# Altium schematic sheet Relay-Sheet.SchDoc: =Projectname
size A4; SheetNumber: 6; SheetTotal: 9
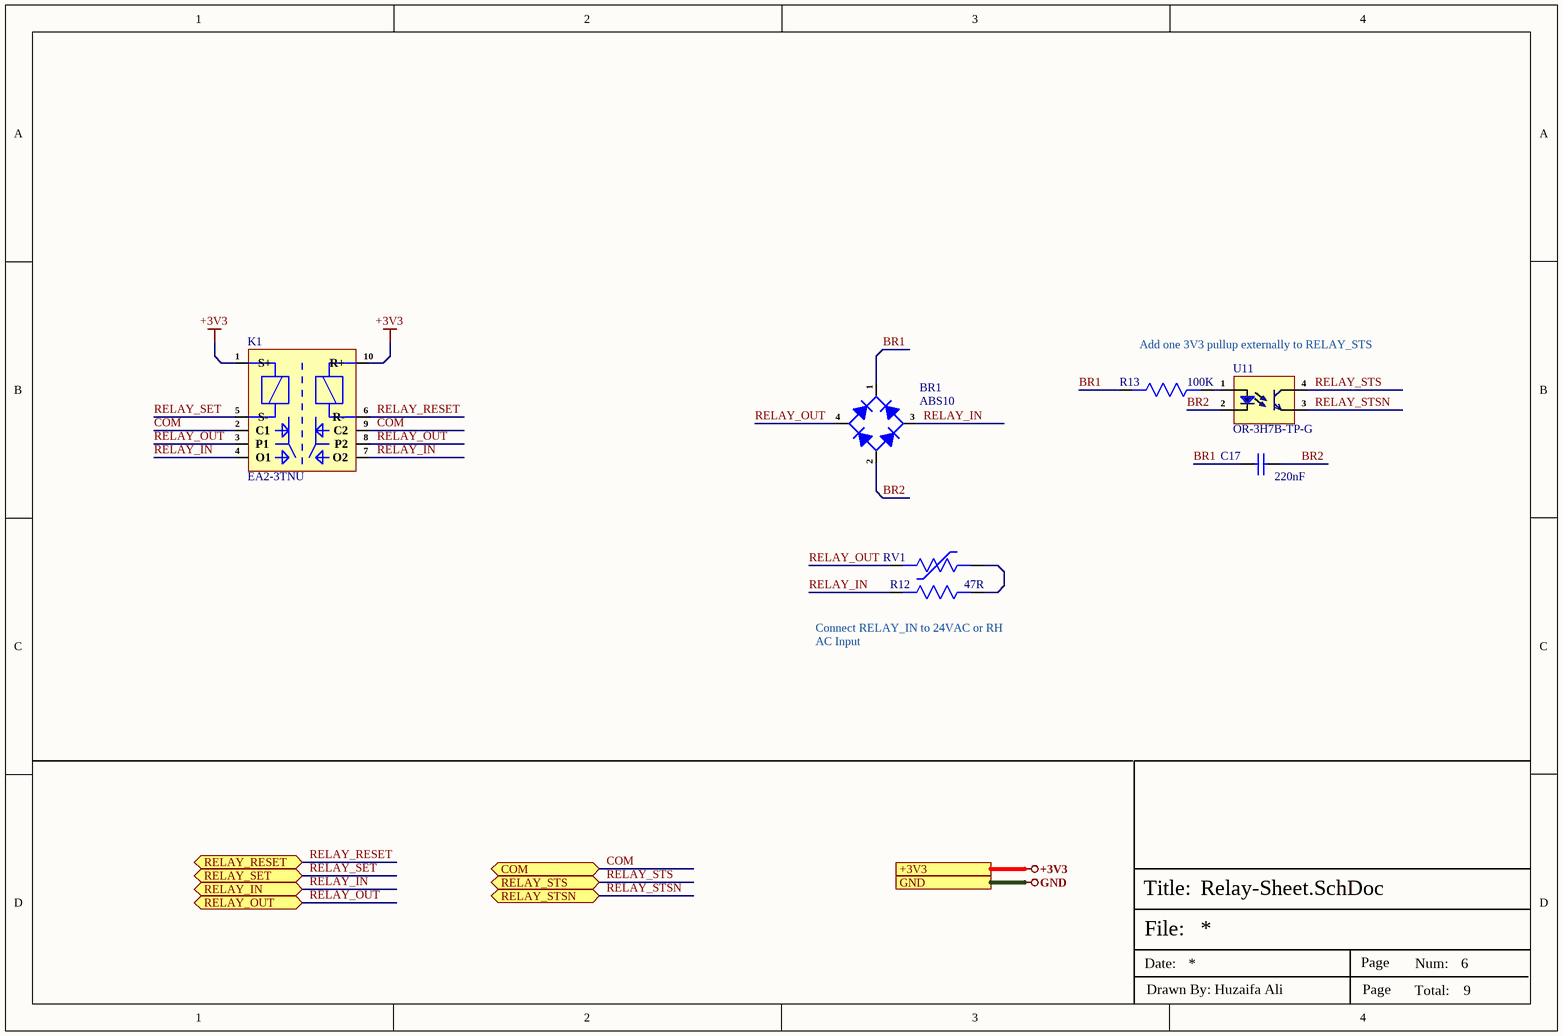
[diagram p0: Relay-Sheet.SchDoc]

## Parts
BR1  ABS10  [ABS]
C17  220nF  [Cap-1206]
K1  EA2-3TNU  [EA2-3TNU]
R12  47R  [Res-0402]
R13  100K  [Res-0402]
RV1  ERZ-V07D680  [ERZ-V07D680]  (value not drawn)
U11  OR-3H7B-TP-G  [SOP-4-1.27mm pitch Body 2.6mm]

## Ports
+3V3, COM (bidir), GND, RELAY_IN (bidir), RELAY_OUT (bidir), RELAY_RESET (bidir), RELAY_SET (bidir), RELAY_STS (bidir), RELAY_STSN (bidir)

## Nets
+3V3: K1.1(S+) K1.10(R+) ; port +3V3
GND: port GND
BR1: BR1.1 C17.2 R13.2
BR2: BR1.2 C17.1 U11.2(Ca)
COM: K1.2(C1) K1.9(C2) ; port COM
RELAY_IN: BR1.3 K1.4(O1) K1.7(O2) R12.2 ; port RELAY_IN
RELAY_OUT: BR1.4 K1.3(P1) K1.8(P2) RV1.2 ; port RELAY_OUT
RELAY_RESET: K1.6(R-) ; port RELAY_RESET
RELAY_SET: K1.5(S-) ; port RELAY_SET
RELAY_STS: U11.4(C) ; port RELAY_STS
RELAY_STSN: U11.3(E) ; port RELAY_STSN
NetR12_1: R12.1 RV1.1
NetR13_1: R13.1 U11.1(An)

## Notes on the sheet
- Add one 3V3 pullup externally to RELAY_STS
- (near R12) Connect RELAY_IN to 24VAC or RH
  AC Input
- File:
- Title:
- Date:
- Page
- Num:
- Total:
- Drawn By: Huzaifa Ali

## Library data of the parts
BR1 = ABS10: 5uA@1kV 1V@0.4A 1A 1kV -55℃~+150℃@(Tj) ABS Bridge Rectifiers ROHS; Manufacturer: FOSAN; Package: ABS; Manufacturer Part Number: ABS10; Item Type: Bridge Rectifier; LCSC Part Number: C3014049; ComponentLink1Description: LCSC; ComponentLink1URL: https://www.lcsc.com/product-detail/Bridge-Rectifiers_FOSAN-ABS10_C3014049.html
C17 = 1206B224K500NT: 50V 220nF X7R ±10% 1206 Multilayer Ceramic Capacitors MLCC - SMD/SMT ROHS; Manufacturer: FH; Manufacturer Part Number: 1206B224K500NT; Package: 1206; LCSC Part Number: C1857; Item Type: Capacitor; ComponentLink1Description: LCSC; ComponentLink1URL: https://www.lcsc.com/product-detail/Multilayer-Ceramic-Capacitors-MLCC-SMD-SMT_FH-Guangdong-Fenghua-Advanced-Tech-1206B224K500NT_C1857.html
K1 = EA2-3TNU: Relay Gen Purpose DPDT 1A 3VDC; Manufacturer: KEMET; Coil Current: 46.7mA; Coil Type: Latching, Dual Coil; Coil Voltage (DC): 3V; Coil Resistance: 64.3R; Relay Type: General Purpose; Operate Time: 2ms; Release Time: 1ms; Coil Power: 140mW; Supplier 1: Mouser; Manufacturer Part Number: EA2-3TNU; RoHS: No; Category: Uncategorized; Stock 1: 873; Pricing 1: 1=3.85000, 10=3.11000, 50=3.11000, 100=2.42000, 250=2.00000, 500=1.85000, 1000=1.85000, 3600=1.58000, 10000=1.58000 (USD); Mount: Through Hole; Contact Material: Gold,Silver; Min Operating Temperature: -40°C; Max Operating Temperature: 85°C; Throw Configuration: DPDT; Package Quantity: 3600; Termination: PC Pin; Packaging: Rail/Tube; Contact Current Rating: 1A; RoHS Compliant: No; ComponentLink1URL: https://api.kemet.com/component-edge/download/datasheet/EA2-3TNU.pdf?src-supplier=Digi-Key; ComponentLink1Description: https://api.kemet.com/component-edge/download/datasheet/EA2-3TNU.pdf?src-supplier=Digi-Key; Supplier Part Number 1: 80-EA2-3TNU; LCSC Part Number: C1560650; Item Type: Relay
R12 = RC0402FR-0747RL: RES 47 OHM 1% 1/16W 0402; Manufacturer: Yageo; Temperature Coefficient: 100ppm/°C; Power Rating: 63mW; Voltage Rating: 50V; Supplier 1: Digi-Key; Manufacturer Part Number: RC0402FR-0747RL; RoHS: Yes; Category: Chip SMD Resistors; Stock 1: 913647; Pricing 1: 1=0.10000, 10=0.01400, 100=0.00580, 1000=0.00262, 2500=0.00228, 5000=0.00188 (USD); Case/Package: 0402; Case Code (Metric): 1005; Case Code (Imperial): 0402; Weight: 2.3E-05oz; Size Code: 0402; Min Operating Temperature: -55°C; Max Operating Temperature: 155°C; Resistance: 47R; Tolerance: 1%; Packaging: Tape and Reel; Resistor Type: Thick Film; Package Quantity: 1; Number of Terminations: 2; Termination: SMD/SMT; Max Power Dissipation: 63mW; Features: Moisture Resistant; Series: RC; Construction: Rectangular; Technology: THICK FILM; Resistance Tolerance: 1%; Length: 1mm; Width: 0.02inch; Height: 0.016inch; Depth: 0.5mm; Lead Free: Lead Free; Military Standard: Not; RoHS Compliant: Yes; Supplier Part Number 1: 311-47.0LRCT-ND
R13 = RC0402FR-07100KL: RES 100K OHM 1% 1/16W 0402; Manufacturer: Yageo; Resistance: 100kR; Temperature Coefficient: 100ppm/°C; Power Rating: 63mW; Voltage Rating: 50V; Supplier 1: Mouser; Manufacturer Part Number: RC0402FR-07100KL; RoHS: Yes; Category: Chip SMD Resistors; Stock 1: 7759549; Pricing 1: 1=0.10000, 10=0.01200, 50=0.01200, 100=0.00500, 1000=0.00300, 2500=0.00200, 10000=0.00100 (USD); Case/Package: 0402; Case Code (Metric): 1005; Case Code (Imperial): 0402; Min Operating Temperature: -55°C; Max Operating Temperature: 155°C; Resistor Type: Thick Film; Tolerance: 1%; Packaging: Tape and Reel; Package Quantity: 1; Number of Terminations: 2; Termination: SMD/SMT; Max Power Dissipation: 63mW; Working Voltage: 50V; Features: Moisture Resistant; Series: RC; Resistance Tolerance: 1%; Construction: Rectangular; Technology: THICK FILM; Length: 0.039inch; Width: 0.02inch; Height: 0.016inch; Depth: 0.5mm; REACH SVHC: No SVHC; Lead Free: Lead Free; RoHS Compliant: Yes; Military Standard: Not; ComponentLink1URL: https://datasheet.ciiva.com/11819/0900766b80c66297-11819452.pdf?src-supplier=RSComponents; ComponentLink1Description: https://datasheet.ciiva.com/11819/0900766b80c66297-11819452.pdf?src-supplier=RSComponents; ComponentLink2URL: https://datasheet.ciiva.com/22747/1018594-22747509.pdf?src-supplier=Element14; ComponentLink2Description: https://datasheet.ciiva.com/22747/1018594-22747509.pdf?src-supplier=Element14; ComponentLink3URL: https://datasheet.ciiva.com/2453/pyu-r-int-thick-7-2453362.pdf?src-supplier=Digi-Key; ComponentLink3Description: https://datasheet.ciiva.com/2453/pyu-r-int-thick-7-2453362.pdf?src-supplier=Digi-Key; ComponentLink4URL: https://datasheet.ciiva.com/2453/pyu-r-int-thick-7-2453363.pdf?src-supplier=Digi-Key; ComponentLink4Description: https://datasheet.ciiva.com/2453/pyu-r-int-thick-7-2453363.pdf?src-supplier=Digi-Key; ComponentLink5URL: https://datasheet.ciiva.com/2453/pyu-r-int-thick-7-2453361.pdf?src-supplier=Digi-Key; ComponentLink5Description: https://datasheet.ciiva.com/2453/pyu-r-int-thick-7-2453361.pdf?src-supplier=Digi-Key; ComponentLink6URL: https://datasheet.ciiva.com/12667/pyu-rc0402-51-rohs-l-6-r-12667930.pdf?src-supplier=Mouser; ComponentLink6Description: https://datasheet.ciiva.com/12667/pyu-rc0402-51-rohs-l-6-r-12667930.pdf?src-supplier=Mouser; ComponentLink7URL: https://datasheet.ciiva.com/15189/getdatasheetpartid-323696-15189334.pdf?src-supplier=Verical; ComponentLink7Description: https://datasheet.ciiva.com/15189/getdatasheetpartid-323696-15189334.pdf?src-supplier=Verical; Supplier Part Number 1: 603-RC0402FR-07100KL
RV1 = ERZ-V07D680: VARISTOR 68V 500A DISC 7MM; Manufacturer: Panasonic; Max Voltage Rating (AC): 40V; Max Voltage Rating (DC): 56V; Capacitance: 1.2nF; Lead/Base Style: Radial; Clamping Voltage: 135V; Clamping Current: 2.5A; Voltage Rating: 75V; Min Varistor Voltage: 61V; Number of Circuits: 1; Energy: 4.1J; Power Rating: 20mW; Supplier 1: Avnet; Manufacturer Part Number: ERZ-V07D680; RoHS: Yes; Category: Varistors; Stock 1: 397; Pricing 1: 1000=0.07517, 1100=0.07421, 2100=0.07294, 5000=0.07103, 10000=0.07039 (USD); Mount: Through Hole,Radial; Case/Package: Radial; Contact Plating: Tin,Matte; Material: Zinc; Min Operating Temperature: -40°C; Max Operating Temperature: 85°C; Max Surge Current: 500A; Voltage Rating (DC): 56V; Voltage Rating (AC): 40V; Packaging: Bulk; Varistor Voltage: 68V; Termination: Radial; Package Quantity: 1000; Max Varistor Voltage: 75V; Max Output Current: 2.5A; Diameter: 7mm; Lead Pitch: 5mm; Depth: 5.2mm; Thickness: 5.2mm; Radiation Hardening: No; Lead Free: Lead Free; ComponentLink1URL: https://datasheet.ciiva.com/11834/0900766b80eefb4d-11834669.pdf?src-supplier=RSComponents; ComponentLink1Description: https://datasheet.ciiva.com/11834/0900766b80eefb4d-11834669.pdf?src-supplier=RSComponents; ComponentLink2URL: https://datasheet.ciiva.com/1278/652464-1278833.pdf?src-supplier=Element14; ComponentLink2Description: https://datasheet.ciiva.com/1278/652464-1278833.pdf?src-supplier=Element14; ComponentLink3URL: https://datasheet.ciiva.com/1283/652464-1283255.pdf?src-supplier=Farnell; ComponentLink3Description: https://datasheet.ciiva.com/1283/652464-1283255.pdf?src-supplier=Farnell; ComponentLink4URL: https://datasheet.ciiva.com/3023/awa0000ce2-3023960.pdf?src-supplier=Avnet; ComponentLink4Description: https://datasheet.ciiva.com/3023/awa0000ce2-3023960.pdf?src-supplier=Avnet; ComponentLink5URL: https://datasheet.ciiva.com/30133/2awa0000ce2-30133483.pdf?src-supplier=Onlinecomponents.com; ComponentLink5Description: https://datasheet.ciiva.com/30133/2awa0000ce2-30133483.pdf?src-supplier=Onlinecomponents.com; ComponentLink6URL: https://datasheet.ciiva.com/16440/awa0000ce2-16440124.pdf?src-supplier=Future+Electronics; ComponentLink6Description: https://datasheet.ciiva.com/16440/awa0000ce2-16440124.pdf?src-supplier=Future+Electronics; ComponentLink7URL: https://datasheet.ciiva.com/24028/awa0000ce2-33884-24028073.pdf?src-supplier=Mouser; ComponentLink7Description: https://datasheet.ciiva.com/24028/awa0000ce2-33884-24028073.pdf?src-supplier=Mouser; ComponentLink8URL: https://datasheet.ciiva.com/1231/652464-1231981.pdf?src-supplier=Newark; ComponentLink8Description: https://datasheet.ciiva.com/1231/652464-1231981.pdf?src-supplier=Newark; Supplier Part Number 1: ERZ-V07D680; LCSC Part Number: C1527506; Item Type: Varistor
U11 = OR-3H7B-TP-G: 80V 3750V 2us@2mA,100Ω -55℃~+125℃ 50mA 3us@2mA,100Ω 0.4V@2.4mA,8mA 1 6V 1.2V Phototransistor DC SOP-4-2.6mm Optocouplers - Phototransistor Output ROHS; Manufacturer: Orient; Manufacturer Part Number: OR-3H7B-TP-G; Package: SOP-4-2.6mm; LCSC Part Number: C282477; Item Type: Optocoupler; ComponentLink1Description: LCSC; ComponentLink1URL: https://www.lcsc.com/product-detail/Optocouplers-Phototransistor-Output_Orient-OR-3H7B-TP-G_C282477.html